# Altium schematic sheet DAC and Output.schdoc
size 297 x 209 mm; Symbol: Drawing-Symbol_A4; @Project Name: Pedal Steel; @Page Count: 1; @Update Date: 2026-10-20; @Create Date: 2026-10-20; @Schematic Name: Schematic1; @Page No: 1; @Page Name: P1; Company: EasyEDA.com; Version: V1.0; Page Size: A4; Device: Drawing-Symbol_A4; @Create Time: 17:30:55; @Update Time: 17:30:55; Border: 1; Width: 1170; Height: 825; Region Start: 1; X Region Count: 6; Y Region Count: 4; Blade Width: 10; Title Block Position: 3
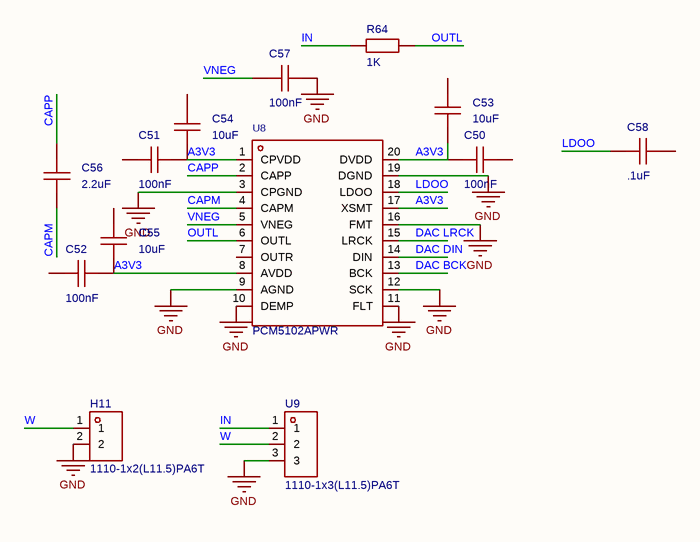
[diagram p0: DAC and Output.schdoc]

## Parts
C50  100nF  [C0603]
C51  100nF  [C0603]
C52  100nF  [C0603]
C53  10uF  [C0603]
C54  10uF  [C0603]
C55  10uF  [C0603]
C56  2.2uF  [C0603]
C57  100nF  [C0603]
C58  .1uF  [C0603]
H11  1110-1x2(L11.5)PA6T  [HDR-TH_2P-P2.54-H-M-W9.0]
R64  1K  [R0603]
U8  PCM5102APWR  [TSSOP-20_L6.5-W4.4-P0.65-LS6.4-BL]
U9  1110-1x3(L11.5)PA6T  [HDR-TH_3P-P2.54-H-M-W8.0]

## Nets
GND: C57.1 H11.2 U8.3(CPGND) U8.9(AGND) U8.10(DEMP) U8.11(FLT) U8.12(SCK) U8.16(FMT) U8.19(DGND) U9.3
A3V3: C50.2 C51.1 C52.1 C53.2 C54.2 C55.2 U8.1(CPVDD) U8.8(AVDD) U8.17(XSMT) U8.20(DVDD)
CAPM: C56.2 U8.4(CAPM)
CAPP: C56.1 U8.2(CAPP)
DAC BCK: U8.13(BCK)
DAC DIN: U8.14(DIN)
DAC LRCK: U8.15(LRCK)
IN: R64.1 U9.1
LDOO: C58.2 U8.18(LDOO)
OUTL: R64.2 U8.6(OUTL)
VNEG: C57.2 U8.5(VNEG)
W: H11.1 U9.2

Not connected (* = marked no-connect by the designer): C50 1; C51 2; C52 2; C53 1; C54 1; C55 1; C58 1; U8 7(OUTR)

## Notes on the sheet
- Create at
- 2026-10-20
- Schematic
- Board
- Schematic1
- Update at
- Page
- P1
- Drawn
- Reviewed
- Pedal Steel
- Version
- V1.0
- Size
- A4
- Page  1  Total  1
- EasyEDA.com

## Library data of the parts
C50-C58 = CAP_0603: Symbol: CAP_OLD; ConvertToPcb: yes; ModelId: 624118aa3cc7497086c383c2d72e08520819f05c4eef4c71ace90d822a990e87; ModelName: C0603_L1.6-W0.8-H0.8; ModelTransform: 62.992,31.496,0,0,0,0,0,0,0; Device: CAP_0603; AddInBom: yes; Supplier Footprint: 0603; FootprintName: C0603
  C50-C52 C57: Value: 100nF
  C53-C55: Value: 10uF
  C56: Value: 2.2uF
  C58: Value: .1uF
H11 = 1110-1x2(L11.5)PA6T: Pin Structure:1x2P Pitch:2.54mm Circluar Pins/Square Pins:Square pin Mounting Type:Right Angle Number of Rows:1 Number of Pins:2P Current Rating:3A Voltage Rating (Max):250V Length of Mating Pin:3.5mm Insulation Height:2.54mm Contact Material:Brass Contac; Manufacturer: CST(永丰盈); AddInBom: yes; ModelId: 7248d4bf3ef34400a5851ce875e9671e0819f05c4eef4c71ace90d822a990e87; ModelTransform: 196.063,354.33,0,0,0,0,0,-165.354,-118.11; Pin Structure: 1x2P; Pitch: 2.54mm; Current Rating: 3A; Voltage Rating (Max): 250V; Symbol: 1110-1X2(L11.5)PA6T; Device: 1110-1x2(L11.5)PA6T; LCSC Part Name: 黑色 1x2P 间距:2.54mm 方针 弯插; SupplierPart: C18214182; ManufacturerPart: 1110-1x2(L11.5)PA6T; Supplier Footprint: 插件,P=2.54mm; JLCPCB Part Class: Extended Part; Datasheet: https://item.szlcsc.com/datasheet/1110-1x2(L11.5)PA6T/19392521.html; Supplier: LCSC; ConvertToPcb: yes; FootprintName: HDR-TH_2P-P2.54-H-M-W9.0; ModelName: HDR-TH_2P-P2.54-H-M-W9.0; Circluar Pins/Square Pins: Square pin; Mounting Type: Right Angle; Number of Rows: 1; Number of Pins: 2P; Length of Mating Pin: 3.5mm; Insulation Height: 2.54mm; Contact Material: Brass; Contact Plating: Gold; Operating Temperature: -40℃~+105℃; Color: Black
R64 = Res_0603: Symbol: Res; ConvertToPcb: yes; ModelId: 112863783b5b41f1b5254f87eedc79320819f05c4eef4c71ace90d822a990e87; ModelTransform: 31.8897,63.7794,0,90,0,0,0,0,0; Device: Res_0603; Value: 1K; AddInBom: yes; Supplier Footprint: 0603; FootprintName: R0603; ModelName: R0603
U8 = PCM5102APWR: Resolution (Bits):32 Number of Channels:2 Voltage - Supply:1.8V~3.3V Voltage - Supply:1.8V~3.3V Interface Type:I2S The Chip Type:Audio Decoder Operating Temperature:-25℃~+85℃ Operating Temperature:-25℃~+85℃ Sampling Rate:384kHz Quiescent Current (Iq):500u; Manufacturer: TI(德州仪器); AddInBom: yes; ModelId: d00c537554e8428abe371c2c4fe2166f0819f05c4eef4c71ace90d822a990e87; ModelName: TSSOP-20_L6.5-W4.4-H1.0-LS6.4-P0.65; ModelTransform: 251.969,255.906,0,90,0,0,0.0005,0,0; Resolution (Bits): 32; Number of Channels: 2; Interface Type: I2S; Sampling Rate: 384kHz; Quiescent Current (Iq): 500uA; Symbol: PCM5102APWR; Device: PCM5102APWR; Supplier: LCSC; Manufacturer Part: PCM5102APWR; Supplier Part: C107671; JLCPCB Part Class: Extended Part; LCSC Part Name: 具有PLL和32位、384kHz PCM接口的2.1VRMS音频立体声DAC; Supplier Footprint: TSSOP-20; Datasheet: https://www.ti.com/cn/lit/ds/symlink/pcm5102a.pdf; ConvertToPcb: yes; FootprintName: TSSOP-20_L6.5-W4.4-P0.65-LS6.4-BL; Voltage - Supply: 1.8V~3.3V; The Chip Type: Audio Decoder; Operating Temperature: -25℃~+85℃; Integral non - linearity: -; Features: Power-down mode；Digital filtering; Architecture: -; Differential Non - linearity: -
U9 = 1110-1x3(L11.5)PA6T: Pin Structure:1x3P Pitch:2.54mm Circluar Pins/Square Pins:Pin Header Mounting Type:Right Angle Number of Rows:1 Number of Pins:3P Current Rating:3A Voltage Rating (Max):250V Length of Mating Pin:3.5mm Insulation Height:2.54mm Contact Material:Brass Contac; Manufacturer: CST(永丰盈); AddInBom: yes; ModelId: 8af6a733bb33433f90d20139532c28540819f05c4eef4c71ace90d822a990e87; ModelTransform: 300.3931,314.96,0,0,0,0,0,-143.701,-118.11; Pin Structure: 1x3P; Pitch: 2.54mm; Current Rating: 3A; Voltage Rating (Max): 250V; Symbol: 1110-1X3(L11.5)PA6T; Device: 1110-1x3(L11.5)PA6T; LCSC Part Name: 黑色 1x3P 间距:2.54mm 方针 弯插; SupplierPart: C18214183; ManufacturerPart: 1110-1x3(L11.5)PA6T; Supplier Footprint: 插件,P=2.54mm; JLCPCB Part Class: Extended Part; Datasheet: https://item.szlcsc.com/datasheet/1110-1x3(L11.5)PA6T/19392522.html; Supplier: LCSC; ConvertToPcb: yes; FootprintName: HDR-TH_3P-P2.54-H-M-W8.0; ModelName: HDR-TH_3P-P2.54-H-M-W8.0; Circluar Pins/Square Pins: Pin Header; Mounting Type: Right Angle; Number of Rows: 1; Number of Pins: 3P; Length of Mating Pin: 3.5mm; Insulation Height: 2.54mm; Contact Material: Brass; Contact Plating: Gold; Operating Temperature: -40℃~+105℃; Color: Black